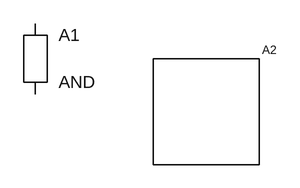
[diagram p0: schematic adevice_prefix_by_attribute.asc]
adevice_prefix_by_attribute.asc, the LTspice schematic file:
Version 4
SHEET 1 880 680
SYMBOL res 80 0 R0
SYMATTR InstName A1
SYMATTR Prefix A
SYMATTR Value AND
SYMBOL cell4 320 64 R0
SYMATTR InstName A2
SYMATTR Prefix A
SYMATTR Value AND

The netlist it stands for:
* adevice_prefix_by_attribute.asc
A1 0 0 0 0 0 0 0 0 AND
A2 0 0 0 0 0 0 0 0 AND
.backanno
.end